# Altium project Smart-Watch-v1.0.PrjPcb
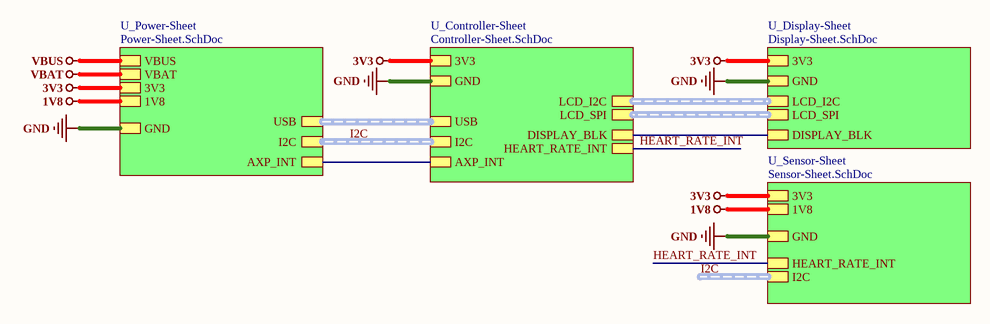
[diagram p0: Top-Sheet.SchDoc]
5 sheets, 64 parts. Net scope: hierarchical (ports join the sheet entries above them; power ports are global).
Board file: PCB_Smart-Watch-v1.0.PcbDoc
Sheets:
  Top-Sheet.SchDoc
    U_Power-Sheet = Power-Sheet.SchDoc
    U_Controller-Sheet = Controller-Sheet.SchDoc
    U_Display-Sheet = Display-Sheet.SchDoc
    U_Sensor-Sheet = Sensor-Sheet.SchDoc

## Sheet Top-Sheet.SchDoc
size A4; SheetNumber: 1; SheetTotal: 5

### Sub-sheets
U_Controller-Sheet = Controller-Sheet.SchDoc: LCD_I2C (harness LCD_I2C), USB (harness USB), LCD_SPI (harness LCD_SPI), DISPLAY_BLK, HEART_RATE_INT, GND, 3V3, AXP_INT, I2C (harness I2C)
U_Display-Sheet = Display-Sheet.SchDoc: LCD_SPI (harness LCD_SPI), DISPLAY_BLK, LCD_I2C (harness LCD_I2C), GND, 3V3
U_Power-Sheet = Power-Sheet.SchDoc: USB (harness USB), I2C (harness I2C), GND, 1V8, 3V3, VBAT, VBUS, AXP_INT
U_Sensor-Sheet = Sensor-Sheet.SchDoc: GND, 1V8, 3V3, HEART_RATE_INT, I2C (harness I2C)

### Nets
1V8: sheet U_Power-Sheet/1V8, sheet U_Sensor-Sheet/1V8
3V3: sheet U_Power-Sheet/3V3, sheet U_Controller-Sheet/3V3, sheet U_Display-Sheet/3V3, sheet U_Sensor-Sheet/3V3
GND: sheet U_Power-Sheet/GND, sheet U_Controller-Sheet/GND, sheet U_Display-Sheet/GND, sheet U_Sensor-Sheet/GND
AXP_INT: sheet U_Power-Sheet/AXP_INT, sheet U_Controller-Sheet/AXP_INT
DISPLAY_BLK: sheet U_Controller-Sheet/DISPLAY_BLK, sheet U_Display-Sheet/DISPLAY_BLK
HEART_RATE_INT: sheet U_Controller-Sheet/HEART_RATE_INT, sheet U_Sensor-Sheet/HEART_RATE_INT

### Buses and harness runs
harness I2C = sheet U_Controller-Sheet/I2C = sheet U_Power-Sheet/I2C
harness I2C = sheet U_Sensor-Sheet/I2C
harness sheet U_Controller-Sheet/LCD_I2C = sheet U_Display-Sheet/LCD_I2C
harness sheet U_Controller-Sheet/LCD_SPI = sheet U_Display-Sheet/LCD_SPI
harness sheet U_Controller-Sheet/USB = sheet U_Power-Sheet/USB

### Notes on the sheet
- File:
- Title:
- Date:
- Page
- Num:
- Total:
- Drawn By: Huzaifa Ali

## Sheet Power-Sheet.SchDoc
size A4; SheetNumber: 2; SheetTotal: 5
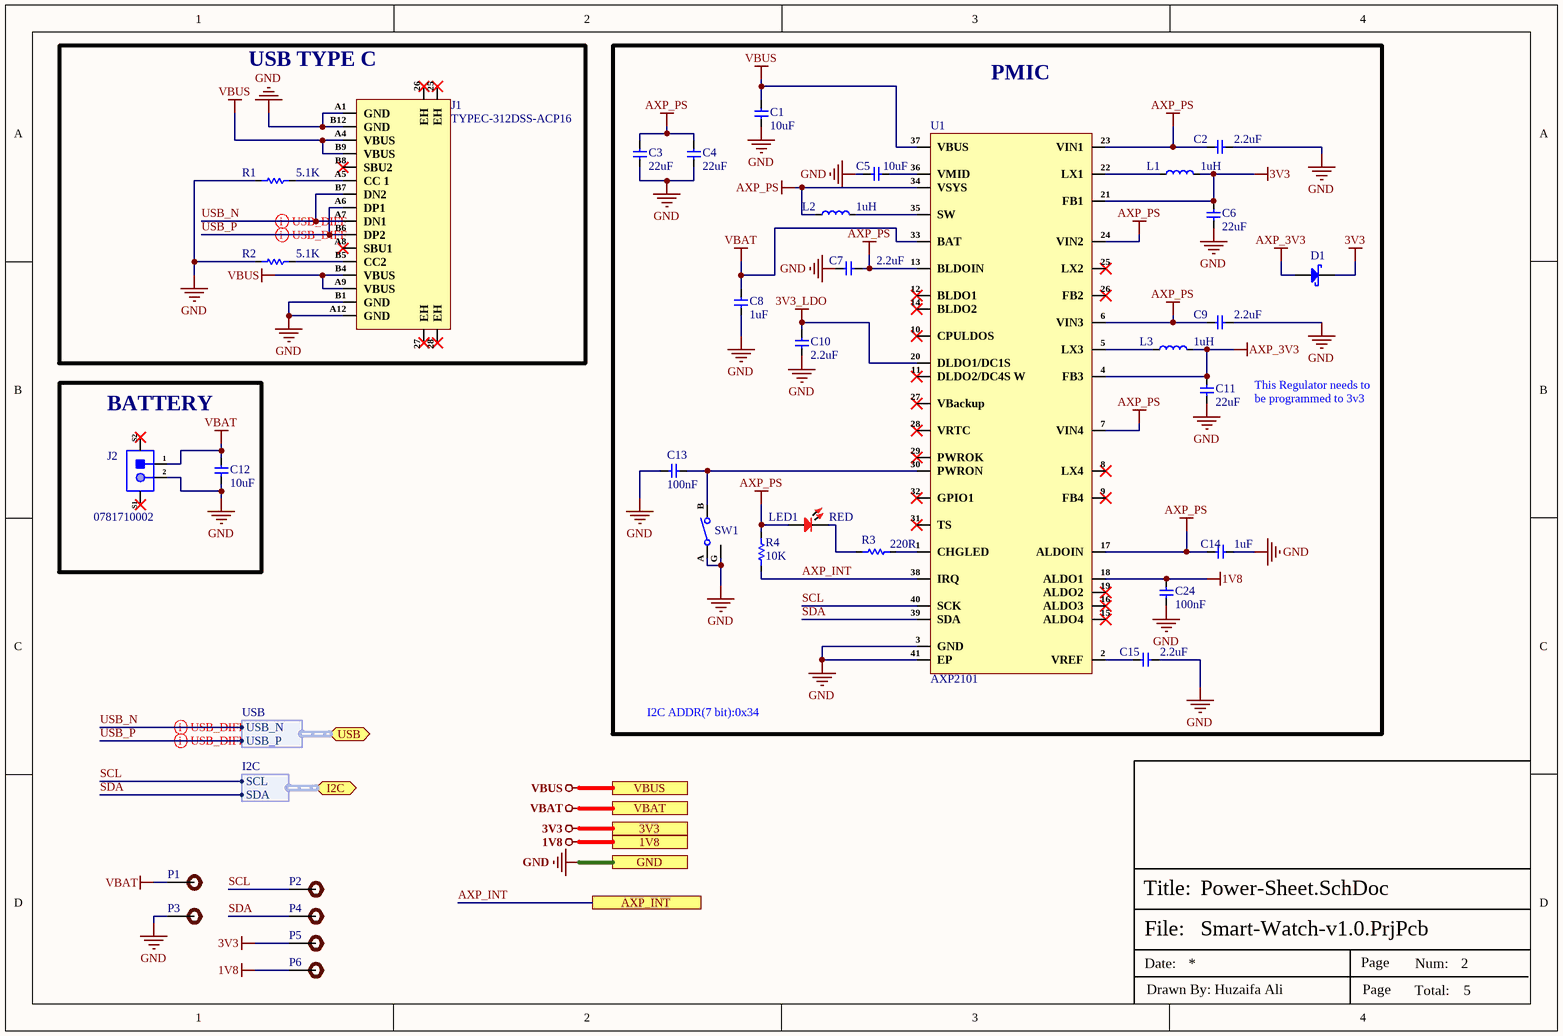
[diagram p1: Power-Sheet.SchDoc]

### Parts
C1  10uF  [Cap-0402]
C2  2.2uF  [CAP-0201]
C3  22uF  [Cap-0402]
C4  22uF  [Cap-0402]
C5  10uF  [Cap-0402]
C6  22uF  [Cap-0402]
C7  2.2uF  [CAP-0201]
C8  1uF  [CAP-0201]
C9  2.2uF  [CAP-0201]
C10  2.2uF  [CAP-0201]
C11  22uF  [Cap-0402]
C12  10uF  [Cap-0402]
C13  100nF  [CAP-0201]
C14  1uF  [CAP-0201]
C15  2.2uF  [CAP-0201]
C24  100nF  [CAP-0201]
D1  B5819WS  [SOD-323]  (value not drawn)
J1  TYPEC-312DSS-ACP16  [TYPEC-312DSS-ACP16]
J2  0781710002  [0781710002]
L1  1uH  [WPN201610M1R0MT]
L2  1uH  [WPN201610M1R0MT]
L3  1uH  [WPN201610M1R0MT]
LED1  RED  [LED-0201]
P1  TEST POINT 0.5mm Dia  [Test-point - 0.5mm]  (value not drawn)
P2  TEST POINT 0.5mm Dia  [Test-point - 0.5mm]  (value not drawn)
P3  TEST POINT 0.5mm Dia  [Test-point - 0.5mm]  (value not drawn)
P4  TEST POINT 0.5mm Dia  [Test-point - 0.5mm]  (value not drawn)
P5  TEST POINT 0.5mm Dia  [Test-point - 0.5mm]  (value not drawn)
P6  TEST POINT 0.5mm Dia  [Test-point - 0.5mm]  (value not drawn)
R1  5.1K  [Res-0201]
R2  5.1K  [Res-0201]
R3  220R  [Res-0201]
R4  10K  [Res-0201]
SW1  R-667799  [R-667799]  (value not drawn)
U1  AXP2101  [40-QFN (5mm×5mm)]

### Blocks framed on the sheet
USB TYPE C: J1 R1 R2
PMIC: C1-C11 C13-C15 C24 D1 L1-L3 LED1 R3 R4 SW1 U1
BATTERY: C12 J2

### Ports
1V8 (see Top-Sheet[1B], Sensor-Sheet[3C]), 3V3 (see Top-Sheet[1B], Controller-Sheet[3D], Display-Sheet[3D], Sensor-Sheet[3C]), AXP_INT (see Top-Sheet[2B], Controller-Sheet[3D]), GND (see Top-Sheet[1B], Controller-Sheet[3D], Display-Sheet[3D], Sensor-Sheet[3C]), I2C (bidir, harness I2C, see Top-Sheet[2B], Controller-Sheet[1D], Sensor-Sheet[3C]), USB (bidir, harness USB, see Top-Sheet[2B], Controller-Sheet[2D]), VBAT (see Top-Sheet[1B]), VBUS (see Top-Sheet[1B])

### Harnesses
USB: USB_N, USB_P
I2C: SCL, SDA

### Nets
1V8: C24.2 P6.1 U1.18(ALDO1) ; port 1V8
3V3: C6.2 D1.1(K) L1.2 P5.1 U1.21(FB1) ; port 3V3
3V3_LDO: C10.2 U1.20(DLDO1/DC1S)
AXP_3V3: C11.2 D1.2(A) L3.2 U1.4(FB3)
AXP_PS: C2.1 C3.2 C4.2 C7.2 C9.1 C14.2 L2.1 LED1.1 R4.2 U1.6(VIN3) U1.7(VIN4) U1.13(BLDOIN) U1.17(ALDOIN) U1.23(VIN1) U1.24(VIN2) U1.34(VSYS)
GND: C1.1 C2.2 C3.1 C4.1 C5.2 C6.1 C7.1 C8.1 C9.2 C10.1 C11.1 C12.2 C13.2 C14.1 C15.2 C24.1 J1.A1(GND) J1.A12(GND) J1.B1(GND) J1.B12(GND) J2.2 P3.1 R1.1 R2.1 SW1.A SW1.G U1.3(GND) U1.41(EP) ; port GND
VBAT: C8.2 C12.1 J2.1 P1.1 U1.33(BAT) ; port VBAT
VBUS: C1.2 J1.A4(VBUS) J1.A9(VBUS) J1.B4(VBUS) J1.B9(VBUS) U1.37(VBUS) ; port VBUS
AXP_INT: R4.1 U1.38(IRQ) ; port AXP_INT
SCL: P2.1 U1.40(SCK) ; port I2C.SCL  [project net I2C.SCL]
SDA: P4.1 U1.39(SDA) ; port I2C.SDA  [project net I2C.SDA]
USB_N: J1.A7(DN1) J1.B7(DN2) ; port USB.USB_N
USB_P: J1.A6(DP1) J1.B6(DP2) ; port USB.USB_P
NetC5_1: C5.1 U1.36(VMID)
NetC13_1: C13.1 SW1.B U1.30(PWRON)
NetC15_1: C15.1 U1.2(VREF)
NetJ1_A5: J1.A5(CC_1) R1.2
NetJ1_B5: J1.B5(CC2) R2.2
NetL1_1: L1.1 U1.22(LX1)
NetL2_2: L2.2 U1.35(SW)
NetL3_1: L3.1 U1.5(LX3)
NetLED1_2: LED1.2 R3.1
NetR3_2: R3.2 U1.1(CHGLED)

Not connected (* = marked no-connect by the designer): J1 25(EH)* 26(EH)* 27(EH)* 28(EH)* A8(SBU1)* B8(SBU2)*; J2 S1* S2*; U1 8(LX4)* 9(FB4)* 10(CPULDOS)* 11(DLDO2/DC4S_W)* 12(BLDO1)* 14(BLDO2)* 15(ALDO4)* 16(ALDO3)* 19(ALDO2)* 25(LX2)* 26(FB2)* 27(VBackup)* 28(VRTC)* 29(PWROK)* 31(TS)* 32(GPIO1)*

### Layout directives
differential pair; net class USB_DIFF; differential pair class USB_DIFF_Lines; rule Matched Net Lengths [Tolerance = 20mil]; rule Impedance Constraint [Min = 85.00    Max = 95.00    ]: USB_N, USB_P

### Notes on the sheet
- This Regulator needs to be programmed to 3v3
- I2C ADDR(7 bit):0x34
- File:
- Title:
- Date:
- Page
- Num:
- Total:
- Drawn By: Huzaifa Ali

### Library data of the parts
C1 C5 C12 = CC0402MRX5R6BB106: CAP CER 10UF 10V X5R 0402; Manufacturer: Yageo; Tolerance: 20%; Item Type: Capacitor; Supplier 1: Future Electronics; Manufacturer Part Number: CC0402MRX5R6BB106; RoHS: Yes; Category: Ceramic Capacitors; Stock 1: 80000; Pricing 1: 10000=0.02650, 20000=0.02590, 30000=0.02550, 40000=0.02530, 50000=0.02450 (USD); Mount: Surface Mount; Case/Package: 0402; Case Code (Imperial): 0402; Case Code (Metric): 1005; Min Operating Temperature: -55°C; Max Operating Temperature: 85°C; Packaging: Tape and Reel; Capacitance: 10uF; Voltage Rating: 10V; RoHS Compliant: Yes; ComponentLink1URL: http://www.yageo.com/documents/recent/UPY-GPHC_X5R_4V-to-50V_25.pdf?src-supplier=Digi-Key; ComponentLink1Description: http://www.yageo.com/documents/recent/UPY-GPHC_X5R_4V-to-50V_25.pdf?src-supplier=Digi-Key; Supplier Part Number 1: 6097631; LCSC Part Number: C962143
C2 C7 C9 C10 C15 = CC0201MRX5R6BB225: CAP CER 2.2UF 10V X5R 0201; Manufacturer: Yageo; Tolerance: 20%; Item Type: Capacitor; Supplier: Mouser; Supplier Part Number: 603-CC0201MRX56BB225; Manufacturer Part Number: CC0201MRX5R6BB225; RoHS: Yes; Category: Ceramic Capacitors; Stock: 25553; Pricing: 1=0.43, 10=0.294, 50=0.294, 100=0.176, 1000=0.112, 10000=0.091 (USD); Mounting Technology: Surface Mount; Case/Package: 0201; Min Operating Temperature: -55°C; Max Operating Temperature: 85°C; Packaging: Tape and Reel; Value: 2.2uF; Voltage Rating: 10V; Series: CC; RoHS Compliant: Yes; ComponentLink1URL: https://www.yageo.com/upload/media/product/productsearch/datasheet/mlcc/UPY-GPHC_X5R_4V-to-50V_26.pdf?src-supplier=Digi-Key; ComponentLink1Description: https://www.yageo.com/upload/media/product/productsearch/datasheet/mlcc/UPY-GPHC_X5R_4V-to-50V_26.pdf?src-supplier=Digi-Key; LCSC Part Number: C2186869
C3 C4 C6 C11 = GRM158R61A226ME15D: CAP CER 22UF 10V X5R 0402; Item Type: Capacitor; Material: 4241ConductorMaterial; Dielectric: 1537DielectricType; Tolerance: 20%; Supplier: Digi-Key; Supplier Part Number: 490-GRM158R61A226ME15DCT-ND; RoHS: Yes; Category: Ceramic Capacitors; Stock: 26634; Pricing: 1=0.45, 10=0.299, 50=0.2202, 100=0.1794, 500=0.1416, 1000=0.11957, 2500=0.11328 (USD); Case/Package: 343Case; Min Operating Temperature: -55°C; Max Operating Temperature: 85°C; Value: 22uF; Voltage Rating: 10V; Voltage Rating (DC): 10V; Length: 1mm; Width: 500um; Height: 800um; Thickness: 800um
C8 C14 = CC0201MRX5R7BB105: CAP CER 1UF 16V X5R 0201; Manufacturer: Yageo; Item Type: Capacitor; Supplier: Digi-Key; Supplier Part Number: 13-CC0201MRX5R7BB105TR-ND; Manufacturer Part Number: CC0201MRX5R7BB105; RoHS: Yes; Category: Ceramic Capacitors; LCSC Part Number: C5182464
C13 C24 = CC0201KRX5R6BB104: CAP CER 0.1UF 10V X5R 0201; Manufacturer: Yageo; Tolerance: 10%; Supplier 1: Mouser; Manufacturer Part Number: CC0201KRX5R6BB104; RoHS: Yes; Category: Ceramic Capacitors; Stock 1: 824403; Pricing 1: 1=0.10000, 10=0.02400, 50=0.02400, 100=0.01900, 1000=0.01100, 10000=0.00900 (USD); Mount: Surface Mount; Case/Package: 0201; Case Code (Imperial): 0201; Case Code (Metric): 0603; Weight: 6E-06oz; Min Operating Temperature: -55°C; Max Operating Temperature: 85°C; Capacitance: 100nF; Dielectric: X5R; Voltage Rating (DC): 10V; Packaging: Tape and Reel; Termination: SMD/SMT; Resistor Type: Ceramic; Voltage Rating: 10V; Series: CC; Construction: Flat; Length: 0.6mm; Width: 0.012inch; Height: 0.3mm; Thickness: 0.013inch; Depth: 0.3mm; Radiation Hardening: No; Lead Free: Lead Free; Halogen Free: Halogen Free; RoHS Compliant: Yes; ComponentLink1URL: https://datasheet.ciiva.com/11587/upy-gphc-x5r-4v-to-50v-12-11587190.pdf?src-supplier=Avnet; ComponentLink1Description: https://datasheet.ciiva.com/11587/upy-gphc-x5r-4v-to-50v-12-11587190.pdf?src-supplier=Avnet; Supplier Part Number 1: 603-CC201KRX5R6BB104; LCSC Part Number: C190183
D1 = B5819WS: DIODE SCHOTTKY 40V 1A SOD323; Manufacturer: MDD; Manufacturer Part Number: B5819WS-TP; Max Surge Current: 10A; Forward Voltage: 900mV; Max Reverse Leakage Current: 1mA; Element Configuration: Single; Supplier 1: Arrow Electronics; RoHS: Yes; Category: Rectifier Diodes; Stock 1: 1701; Pricing 1: 1=0.34370, 10=0.18990, 25=0.18810, 100=0.11820, 250=0.11700, 500=0.08890, 1000=0.07420 (USD); Mount: Surface Mount; Number of Pins: 2; Min Operating Temperature: -65°C; Max Operating Temperature: 125°C; Package Quantity: 1; Packaging: Tape and Reel; Average Rectified Current: 1A; Peak Non-Repetitive Surge Current: 10A; Max Reverse Voltage (DC): 40V; Series: -; Radiation Hardening: No; RoHS Compliant: Yes; Lead Free: Lead Free; Supplier Part Number 1: B5819WS-TP; ComponentLink1Description: LCSC; ComponentLink1URL: https://lcsc.com/product-detail/Schottky-Barrier-Diodes-SBD_MDD-Microdiode-Electronics-B5819WS_C64886.html; LCSC Part Number: C22624; Item Type: Diode
J1 = TYPEC-312DSS-ACP16: USB 3.1 5A 1 260℃ Surface Mount 16P Female -45℃~+85℃ Type-C SMD USB Connectors ROHS; Manufacturer: XUNPU; Manufacturer Part Number: TYPEC-312DSS-ACP16; Package: Custom; LCSC Part Number: C2909601; Item Type: Type-C SMD USB; ComponentLink1Description: LCSC; ComponentLink1URL: https://www.lcsc.com/product-detail/USB-Connectors_XUNPU-TYPEC-312DSS-ACP16_C2909601.html
J2 = 0781710002: CONN HEADER SMD 2POS 1.2MM; Manufacturer: Molex; Item Type: To Board / Wire To Wire Connector; Contact Resistance: 20mR; Max Voltage Rating (AC): 50V; Number of Contacts: 2; Manufacturer Part Number: 0781710002; Package: Custom; LCSC Part Number: C505023; ComponentLink1Description: LCSC; ComponentLink1URL: https://www.lcsc.com/product-detail/Wire-To-Board-Wire-To-Wire-Connector_MOLEX-781710002_C505023.html; Supplier: Mouser; Supplier Part Number: 538-78171-0002; RoHS: Yes; Stock: 82070; Pricing: 1=0.39, 10=0.313, 50=0.313, 100=0.228, 1000=0.181, 10000=0.141 (USD); Housing Material: Polymer; Contact Plating: Gold; Contact Material: Copper Alloy; Housing Color: Black; Min Operating Temperature: -25°C; Max Operating Temperature: 85°C; Number of Rows: 1; Packaging: Tape and Reel; Orientation: Straight; Termination: Solder; Length: 4.2mm; Pitch: 1.2mm; Depth: 4.5mm; Radiation Hardening: No; RoHS Compliant: Yes
L1-L3 = WPN201610M1R0MT: 2.05A 1uH ±20% 3.35A 0806 Power Inductors ROHS; Manufacturer: Sunlord; Supplier: Digi-Key; Supplier Part Number: 3442-WPN201610M1R0MTTR-ND; Manufacturer Part Number: WPN201610M1R0MT; RoHS: Yes; Pricing: 2000=0.17776 (USD); RoHS Compliant: Yes; LCSC Part Number: C97010; Item Type: Inductor
LED1 = XL-0201SURC: 40mcd~75mcd 透明透镜 620nm~630nm -30℃~+85℃ Positive post Red 120° 55mW 0201 Light Emitting Diodes (LED) ROHS; Manufacturer: XINGLIGHT; Manufacturer Part Number: XL-0201SURC; Package: 0201; LCSC Part Number: C3646923; Item Type: LED; ComponentLink1Description: LCSC; ComponentLink1URL: https://www.lcsc.com/product-detail/Light-Emitting-Diodes-LED_XINGLIGHT-XL-0201SURC_C3646923.html
P1-P6 = TEST POINT 0.5mm Dia: Test Point ON; Item Type: Test Point
R1 R2 = RC0201FR-075K1L: RES 5.1K OHM 1% 1/20W 0201; Manufacturer: Yageo; Power Rating: 50mW; Value: 5.1kR; Voltage Rating: 25V; Temperature Coefficient: 200ppm/°C; Item Type: Resistor; Supplier: Future Electronics; Supplier Part Number: 9072847; Manufacturer Part Number: RC0201FR-075K1L; RoHS: Yes; Category: Chip SMD Resistors; Stock: 280000; Pricing: 10000=0.0014, 40000=0.0013, 200000=0.0013, 400000=0.0012, 1250000=0.0011 (USD); Case/Package: 0201; Case Code (Imperial): 0201; Case Code (Metric): 0603; Min Operating Temperature: -55°C; Max Operating Temperature: 125°C; Packaging: Tape and Reel; Tolerance: 1%; Termination: SMD/SMT; Number of Terminations: 2; Max Power Dissipation: 50mW; Features: Moisture Resistant; Series: RC; Length: 0.6mm; Width: 0.3mm; Height: 0.23mm; Lead Free: Lead Free; RoHS Compliant: Yes; ComponentLink1URL: http://www.mouser.com/ds/2/447/RC0201-559633.pdf?src-supplier=Mouser; ComponentLink1Description: http://www.mouser.com/ds/2/447/RC0201-559633.pdf?src-supplier=Mouser; ComponentLink2URL: https://datasheet.octopart.com/RC0201FR-075K1L-Yageo-datasheet-164759695.pdf?src-supplier=Future+Electronics; ComponentLink2Description: https://datasheet.octopart.com/RC0201FR-075K1L-Yageo-datasheet-164759695.pdf?src-supplier=Future+Electronics; ComponentLink3URL: http://www.yageo.com/documents/recent/PYu-RC_Group_51_RoHS_L_10.pdf?src-supplier=Digi-Key; ComponentLink3Description: http://www.yageo.com/documents/recent/PYu-RC_Group_51_RoHS_L_10.pdf?src-supplier=Digi-Key; LCSC Part Number: C274341
R3 = RC0201FR-07220RL: RES 220 OHM 1% 1/20W 0201; Manufacturer: Yageo; Temperature Coefficient: 200ppm/°C; Power Rating: 50mW; Voltage Rating: 25V; Supplier 1: Digi-Key; Manufacturer Part Number: RC0201FR-07220RL; RoHS: Yes; Category: Chip SMD Resistors; Stock 1: 189347; Pricing 1: 1=0.10000, 10=0.03600, 100=0.01480, 1000=0.00665, 2500=0.00577, 5000=0.00477 (USD); Case/Package: 0201; Contact Plating: Tin,Matte; Case Code (Imperial): 0201; Case Code (Metric): 0603; Min Operating Temperature: -55°C; Max Operating Temperature: 125°C; Resistance: 220R; Tolerance: 1%; Resistor Type: Thick Film; Packaging: Tape and Reel; Features: Moisture Resistant; Max Power Dissipation: 50mW; Number of Terminations: 2; Termination: SMD/SMT; Length: 0.6mm; Width: 0.012inch; Height: 0.01inch; Depth: 0.3mm; Radiation Hardening: No; REACH SVHC: Unknown; Military Standard: Not; ComponentLink1URL: https://datasheet.ciiva.com/7672/1563626-7672213.pdf?src-supplier=Element14; ComponentLink1Description: https://datasheet.ciiva.com/7672/1563626-7672213.pdf?src-supplier=Element14; ComponentLink2URL: https://datasheet.ciiva.com/8886/pyu-rc0201-51-rohs-l-8-8886758.pdf?src-supplier=Avnet; ComponentLink2Description: https://datasheet.ciiva.com/8886/pyu-rc0201-51-rohs-l-8-8886758.pdf?src-supplier=Avnet; ComponentLink3URL: https://datasheet.ciiva.com/16855/pyu-rc0201-51-rohs-l-8-16855847.pdf?src-supplier=Avnet+Europe; ComponentLink3Description: https://datasheet.ciiva.com/16855/pyu-rc0201-51-rohs-l-8-16855847.pdf?src-supplier=Avnet+Europe; ComponentLink4URL: https://datasheet.ciiva.com/28393/pyu-rc0201-51-rohs-l-8-28393063.pdf?src-supplier=Avnet+Europe; ComponentLink4Description: https://datasheet.ciiva.com/28393/pyu-rc0201-51-rohs-l-8-28393063.pdf?src-supplier=Avnet+Europe; Supplier Part Number 1: YAG2509CT-ND; LCSC Part Number: C274342
R4 = RC0201FR-0710KL: RES SMD 10K OHM 1% 1/20W 0201; Manufacturer: Yageo; Item Type: Resistor; Manufacturer Part Number: RC0201FR-0710KL; Package: 0201; ComponentLink7Description: LCSC; ComponentLink7URL: https://www.lcsc.com/product-detail/Chip-Resistor-Surface-Mount_YAGEO-RC0201FR-0710KL_C106225.html; LCSC Part Number: C106225
SW1 = R-667799: SWITCH TACTILE, SPST-NO, 0.05A 1; Manufacturer: Mitsumi; Item Type: Tactile Switch; Supplier: Digi-Key; Supplier Part Number: 2508-R-667799CT-ND; Manufacturer Part Number: R-667799; RoHS: No; Category: Tactile Switches; Stock: 11526; Pricing: 1=0.32, 10=0.31, 25=0.2944, 100=0.2666, 250=0.24304, 500=0.2259, 1000=0.19271, 2500=0.18736 (USD)
U1 = AXP2101: QFN-40-EP(5x5) Microcontroller Units (MCUs/MPUs/SOCs) ROHS; Manufacturer: X-Powers Tech; Item Type: IC; Manufacturer Part Number: AXP2101; Package: QFN-40-EP(5x5); JLCPCB Part Number: C3036461

## Sheet Controller-Sheet.SchDoc
size A4; SheetNumber: 3; SheetTotal: 5
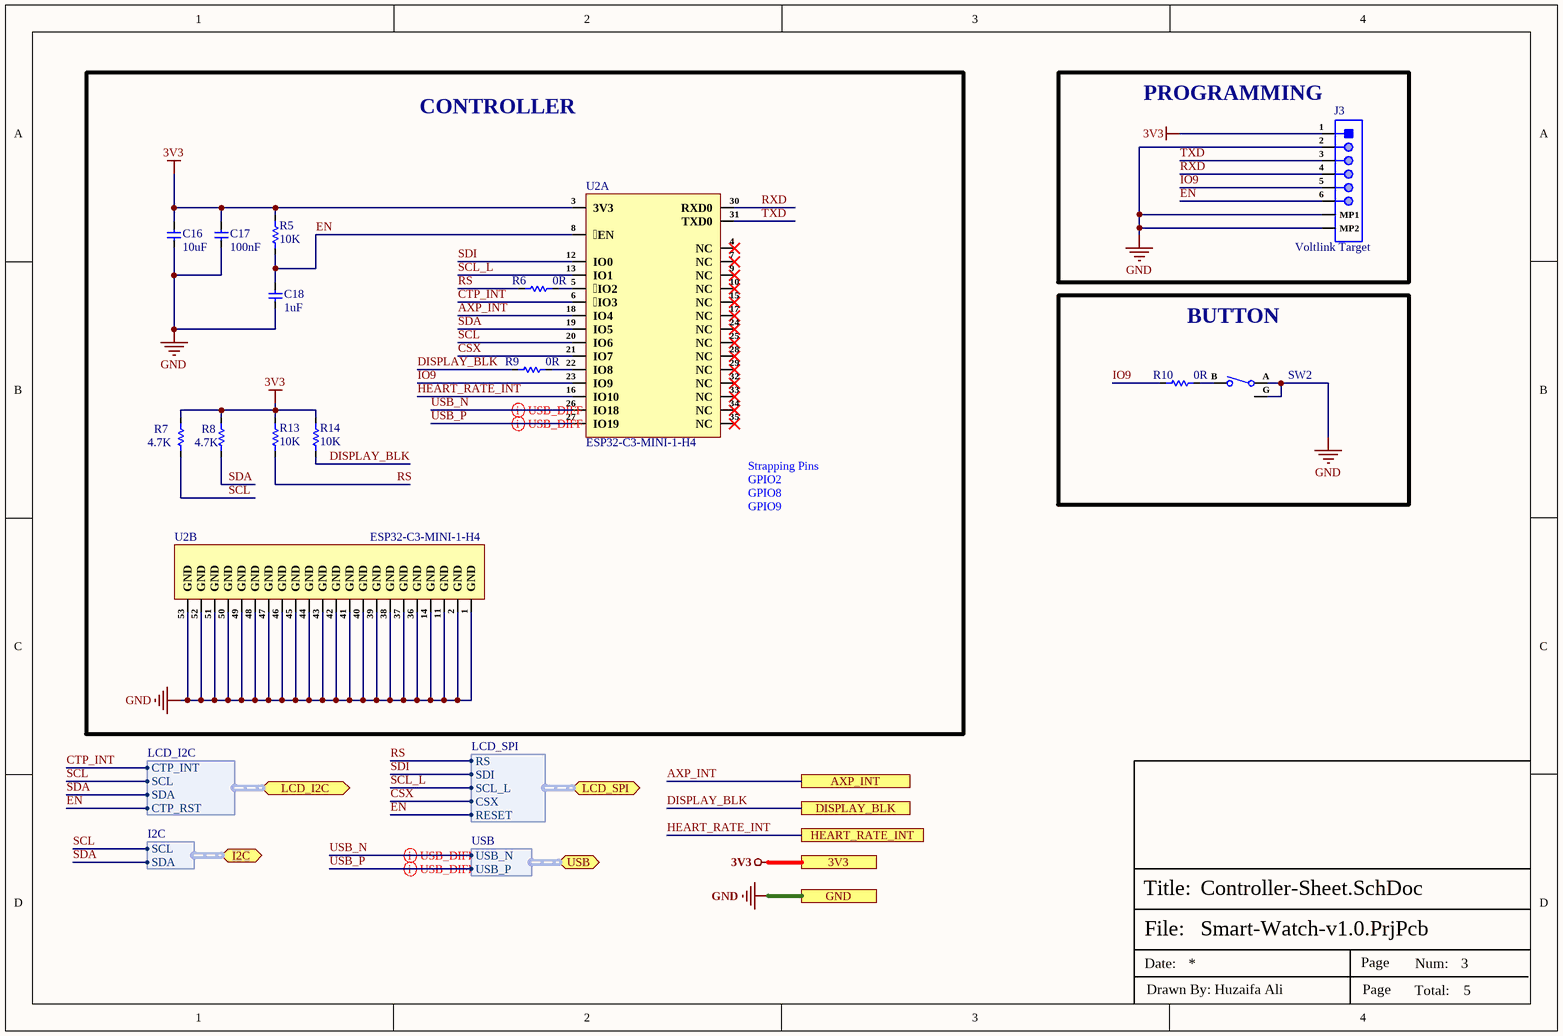
[diagram p2: Controller-Sheet.SchDoc]

### Parts
C16  10uF  [Cap-0402]
C17  100nF  [CAP-0201]
C18  1uF  [CAP-0201]
J3  Voltlink Target  [Voltlink Target]
R5  10K  [Res-0201]
R6  0R  [Res-0201]
R7  4.7K  [Res-0201]
R8  4.7K  [Res-0201]
R9  0R  [Res-0201]
R10  0R  [Res-0201]
R13  10K  [Res-0201]
R14  10K  [Res-0201]
SW2  R-667799  [R-667799]  (value not drawn)
U2  ESP32-C3-MINI-1-H4  [ESP32-C3-MINI-1-H4]  (parts A,B of 2)

### Blocks framed on the sheet
CONTROLLER: C16-C18 R5-R9 R13 R14 U2
PROGRAMMING: J3
BUTTON: R10 SW2

### Ports
3V3 (see Top-Sheet[2B], Display-Sheet[3D], Power-Sheet[2D], Sensor-Sheet[3C]), AXP_INT (see Top-Sheet[2B], Power-Sheet[2D]), DISPLAY_BLK (see Top-Sheet[2B], Display-Sheet[2D]), GND (see Top-Sheet[2B], Display-Sheet[3D], Power-Sheet[2D], Sensor-Sheet[3C]), HEART_RATE_INT (see Top-Sheet[2B], Sensor-Sheet[3C]), I2C (bidir, harness I2C, see Top-Sheet[2B], Power-Sheet[1D], Sensor-Sheet[3C]), LCD_I2C (bidir, harness LCD_I2C, see Top-Sheet[2B], Display-Sheet[2D]), LCD_SPI (bidir, harness LCD_SPI, see Top-Sheet[2B], Display-Sheet[2D]), USB (bidir, harness USB, see Top-Sheet[2B], Power-Sheet[1C])

### Harnesses
LCD_I2C: CTP_INT, SCL, SDA, CTP_RST
USB: USB_N, USB_P
LCD_SPI: RS, SDI, SCL_L, CSX, RESET
I2C: SCL, SDA

### Nets
3V3: C16.2 C17.2 J3.1 R5.2 R7.2 R8.2 R13.2 R14.2 U2.3(3V3) ; port 3V3
GND: C16.1 C17.1 C18.1 J3.2 J3.MP1 J3.MP2 SW2.A SW2.G U2.1(GND) U2.2(GND) U2.11(GND) U2.14(GND) U2.36(GND) U2.37(GND) U2.38(GND) U2.39(GND) U2.40(GND) U2.41(GND) U2.42(GND) U2.43(GND) U2.44(GND) U2.45(GND) U2.46(GND) U2.47(GND) U2.48(GND) U2.49(GND) U2.50(GND) U2.51(GND) U2.52(GND) U2.53(GND) ; port GND
AXP_INT: U2.18(IO4) ; port AXP_INT
CSX: U2.21(IO7) ; port LCD_SPI.CSX
CTP_INT: U2.6(IO3) ; port LCD_I2C.CTP_INT
DISPLAY_BLK: R9.1 R14.1 ; port DISPLAY_BLK
EN: C18.2 J3.6 R5.1 U2.8(EN) ; port LCD_I2C.CTP_RST, port LCD_SPI.RESET  [project net CTP_RST]
HEART_RATE_INT: U2.16(IO10) ; port HEART_RATE_INT
IO9: J3.5 R10.1 U2.23(IO9)
RS: R6.1 R13.1 ; port LCD_SPI.RS
RXD: J3.4 U2.30(RXD0)
SCL: R7.1 U2.20(IO6) ; port LCD_I2C.SCL, port I2C.SCL  [project net I2C.SCL]
SCL_L: U2.13(IO1) ; port LCD_SPI.SCL_L
SDA: R8.1 U2.19(IO5) ; port LCD_I2C.SDA, port I2C.SDA  [project net I2C.SDA]
SDI: U2.12(IO0) ; port LCD_SPI.SDI
TXD: J3.3 U2.31(TXD0)
USB_N: U2.26(IO18) ; port USB.USB_N
USB_P: U2.27(IO19) ; port USB.USB_P
NetR6_2: R6.2 U2.5(IO2)
NetR9_2: R9.2 U2.22(IO8)
NetR10_2: R10.2 SW2.B

Not connected (* = marked no-connect by the designer): U2 4(NC)* 7(NC)* 9(NC)* 10(NC)* 15(NC)* 17(NC)* 24(NC)* 25(NC)* 28(NC)* 29(NC)* 32(NC)* 33(NC)* 34(NC)* 35(NC)*

### Layout directives
differential pair; net class USB_DIFF; differential pair class USB_DIFF_Lines; rule Matched Net Lengths [Tolerance = 20mil]; rule Impedance Constraint [Min = 85.00    Max = 95.00    ]: USB_N, USB_P

### Notes on the sheet
- (near U2) Strapping Pins
  GPIO2
  GPIO8
  GPIO9
- File:
- Title:
- Date:
- Page
- Num:
- Total:
- Drawn By: Huzaifa Ali

### Library data of the parts
C16 = CC0402MRX5R6BB106: as C1 on sheet Power-Sheet; Supplier 1: Future Electronics; Manufacturer Part Number: CC0402MRX5R6BB106; RoHS: Yes; Category: Ceramic Capacitors; Stock 1: 80000; Pricing 1: 10000=0.02650, 20000=0.02590, 30000=0.02550, 40000=0.02530, 50000=0.02450 (USD); Mount: Surface Mount; Case/Package: 0402; Case Code (Imperial): 0402; Case Code (Metric): 1005; Min Operating Temperature: -55°C; Max Operating Temperature: 85°C; Packaging: Tape and Reel; Capacitance: 10uF; Voltage Rating: 10V; RoHS Compliant: Yes; ComponentLink1URL: http://www.yageo.com/documents/recent/UPY-GPHC_X5R_4V-to-50V_25.pdf?src-supplier=Digi-Key; ComponentLink1Description: http://www.yageo.com/documents/recent/UPY-GPHC_X5R_4V-to-50V_25.pdf?src-supplier=Digi-Key; Supplier Part Number 1: 6097631; LCSC Part Number: C962143
C17 = CC0201KRX5R6BB104: as C13 on sheet Power-Sheet; Supplier 1: Mouser; Manufacturer Part Number: CC0201KRX5R6BB104; RoHS: Yes; Category: Ceramic Capacitors; Stock 1: 824403; Pricing 1: 1=0.10000, 10=0.02400, 50=0.02400, 100=0.01900, 1000=0.01100, 10000=0.00900 (USD); Mount: Surface Mount; Case/Package: 0201; Case Code (Imperial): 0201; Case Code (Metric): 0603; Weight: 6E-06oz; Min Operating Temperature: -55°C; Max Operating Temperature: 85°C; Capacitance: 100nF; Dielectric: X5R; Voltage Rating (DC): 10V; Packaging: Tape and Reel; Termination: SMD/SMT; Resistor Type: Ceramic; Voltage Rating: 10V; Series: CC; Construction: Flat; Length: 0.6mm; Width: 0.012inch; Height: 0.3mm; Thickness: 0.013inch; Depth: 0.3mm; Radiation Hardening: No; Lead Free: Lead Free; Halogen Free: Halogen Free; RoHS Compliant: Yes; ComponentLink1URL: https://datasheet.ciiva.com/11587/upy-gphc-x5r-4v-to-50v-12-11587190.pdf?src-supplier=Avnet; ComponentLink1Description: https://datasheet.ciiva.com/11587/upy-gphc-x5r-4v-to-50v-12-11587190.pdf?src-supplier=Avnet; Supplier Part Number 1: 603-CC201KRX5R6BB104; LCSC Part Number: C190183
C18 = CC0201MRX5R7BB105: as C8 on sheet Power-Sheet; Supplier: Digi-Key; Supplier Part Number: 13-CC0201MRX5R7BB105TR-ND; Manufacturer Part Number: CC0201MRX5R7BB105; RoHS: Yes; Category: Ceramic Capacitors; LCSC Part Number: C5182464
J3 = C145963: 1x6P SH 1 1mm 6 SMD,P=1mm Wire To Board / Wire To Wire Connector ROHS; Manufacturer: BOOMELE; Manufacturer Part Number: C145963; Package: SMD,P=1mm; LCSC Part Number: C145963; Item Type: Connector; ComponentLink1Description: LCSC; ComponentLink1URL: https://www.lcsc.com/product-detail/Wire-To-Board-Wire-To-Wire-Connector_BOOMELE-Boom-Precision-Elec-C145963_C145963.html
R5 R13 R14 = RC0201FR-0710KL: as R4 on sheet Power-Sheet; Manufacturer Part Number: RC0201FR-0710KL; Package: 0201; ComponentLink7Description: LCSC; ComponentLink7URL: https://www.lcsc.com/product-detail/Chip-Resistor-Surface-Mount_YAGEO-RC0201FR-0710KL_C106225.html; LCSC Part Number: C106225
R6 R9 R10 = RC0201JR-070RL: RES SMD 0 OHM JUMPER 1/20W 0201; Manufacturer: Yageo; Power Rating: 50mW; Tolerance: 5%; Voltage Rating: 25V; Supplier 1: Digi-Key; Manufacturer Part Number: RC0201JR-070RL; RoHS: Yes; Category: Chip SMD Resistors; Stock 1: 11079; Pricing 1: 1=0.10000, 10=0.03600, 25=0.02640, 50=0.02000, 100=0.01480, 250=0.01128, 500=0.00904, 1000=0.00665, 5000=0.00477 (USD); Case/Package: 0201; Contact Plating: Tin,Matte; Case Code (Metric): 0603; Case Code (Imperial): 0201; Weight: 6E-06oz; Size Code: 0201; Min Operating Temperature: -55°C; Max Operating Temperature: 125°C; Resistor Type: Thick Film; Resistance: 0R; Packaging: Tape and Reel; Package Quantity: 10000; Number of Terminations: 2; Termination: SMD/SMT; Max Power Dissipation: 50mW; Voltage Rating (DC): 25V; Features: Moisture Resistant; Series: RC; Construction: Rectangular; Resistance Tolerance: 5%; Length: 0.6mm; Width: 0.012inch; Height: 0.01inch; Depth: 0.3mm; Radiation Hardening: No; RoHS Compliant: Yes; REACH SVHC: Unknown; Military Standard: Not; Lead Free: Lead Free; ComponentLink1URL: https://datasheet.ciiva.com/7672/1563626-7672247.pdf?src-supplier=Element14; ComponentLink1Description: https://datasheet.ciiva.com/7672/1563626-7672247.pdf?src-supplier=Element14; ComponentLink2URL: https://datasheet.ciiva.com/7660/1421516-7660808.pdf?src-supplier=Element14; ComponentLink2Description: https://datasheet.ciiva.com/7660/1421516-7660808.pdf?src-supplier=Element14; ComponentLink3URL: https://datasheet.ciiva.com/7672/1563626-7672248.pdf?src-supplier=Element14; ComponentLink3Description: https://datasheet.ciiva.com/7672/1563626-7672248.pdf?src-supplier=Element14; ComponentLink4URL: https://datasheet.ciiva.com/16855/pyu-rc0201-51-rohs-l-8-16855994.pdf?src-supplier=Avnet+Europe; ComponentLink4Description: https://datasheet.ciiva.com/16855/pyu-rc0201-51-rohs-l-8-16855994.pdf?src-supplier=Avnet+Europe; ComponentLink5URL: https://datasheet.ciiva.com/28419/pyu-rc0201-51-rohs-l-8-28419660.pdf?src-supplier=Avnet+Europe; ComponentLink5Description: https://datasheet.ciiva.com/28419/pyu-rc0201-51-rohs-l-8-28419660.pdf?src-supplier=Avnet+Europe; ComponentLink6URL: https://datasheet.ciiva.com/46391/1421516-46391340.pdf?src-supplier=Element14; ComponentLink6Description: https://datasheet.ciiva.com/46391/1421516-46391340.pdf?src-supplier=Element14; ComponentLink7URL: https://datasheet.ciiva.com/8896/pyu-rc0201-51-rohs-l-8-8896143.pdf?src-supplier=Avnet; ComponentLink7Description: https://datasheet.ciiva.com/8896/pyu-rc0201-51-rohs-l-8-8896143.pdf?src-supplier=Avnet; Supplier Part Number 1: 311-0.0NCT-ND; LCSC Part Number: C106228
R7 R8 = RC0201FR-074K7L: RES 4.7K OHM 1% 1/20W 0201; Manufacturer: Yageo; Item Type: Resistor; Supplier: Future Electronics; Supplier Part Number: 7537285; Manufacturer Part Number: RC0201FR-074K7L; RoHS: Yes; Category: Chip SMD Resistors; Stock: 1610000; Pricing: 10000=0.0014, 50000=0.0013, 250000=0.0013, 750000=0.0012, 2000000=0.0011 (USD); ComponentLink1URL: https://datasheet.ciiva.com/2493/pyu-r-int-thick-7-2493811.pdf?src-supplier=Digi-Key; ComponentLink1Description: https://datasheet.ciiva.com/2493/pyu-r-int-thick-7-2493811.pdf?src-supplier=Digi-Key; ComponentLink2URL: https://datasheet.ciiva.com/2493/pyu-r-int-thick-7-2493812.pdf?src-supplier=Digi-Key; ComponentLink2Description: https://datasheet.ciiva.com/2493/pyu-r-int-thick-7-2493812.pdf?src-supplier=Digi-Key; ComponentLink3URL: https://datasheet.ciiva.com/2493/pyu-r-int-thick-7-2493813.pdf?src-supplier=Digi-Key; ComponentLink3Description: https://datasheet.ciiva.com/2493/pyu-r-int-thick-7-2493813.pdf?src-supplier=Digi-Key; ComponentLink4URL: https://datasheet.ciiva.com/8892/pyu-rc0201-51-rohs-l-8-8892942.pdf?src-supplier=Avnet; ComponentLink4Description: https://datasheet.ciiva.com/8892/pyu-rc0201-51-rohs-l-8-8892942.pdf?src-supplier=Avnet; ComponentLink5URL: https://datasheet.ciiva.com/7672/1563626-7672233.pdf?src-supplier=Element14; ComponentLink5Description: https://datasheet.ciiva.com/7672/1563626-7672233.pdf?src-supplier=Element14; LCSC Part Number: C138135
SW2 = R-667799: as SW1 on sheet Power-Sheet; Supplier: Digi-Key; Supplier Part Number: 2508-R-667799CT-ND; Manufacturer Part Number: R-667799; RoHS: No; Category: Tactile Switches; Stock: 11526; Pricing: 1=0.32, 10=0.31, 25=0.2944, 100=0.2666, 250=0.24304, 500=0.2259, 1000=0.19271, 2500=0.18736 (USD)
U2 = ESP32-C3-MINI-1-H4: RF TXRX MODULE BT PCB TRACE SMD; Manufacturer: Espressif Systems; Manufacturer Part Number: ESP32-C3-MINI-1-H4; Package: SMD,13.2x16.6mm; LCSC Part Number: C2934569; Item Type: Module; ComponentLink1Description: LCSC; ComponentLink1URL: https://www.lcsc.com/product-detail/WiFi-Modules_Espressif-Systems-ESP32-C3-MINI-1-H4_C2934569.html; Supplier: Digi-Key; Supplier Part Number: 1965-ESP32-C3-MINI-1-H4CT-ND; RoHS: No; Category: Uncategorized; Stock: 35793; Pricing: 1=1.9 (USD)

## Sheet Display-Sheet.SchDoc
size A4; SheetNumber: 5; SheetTotal: 5
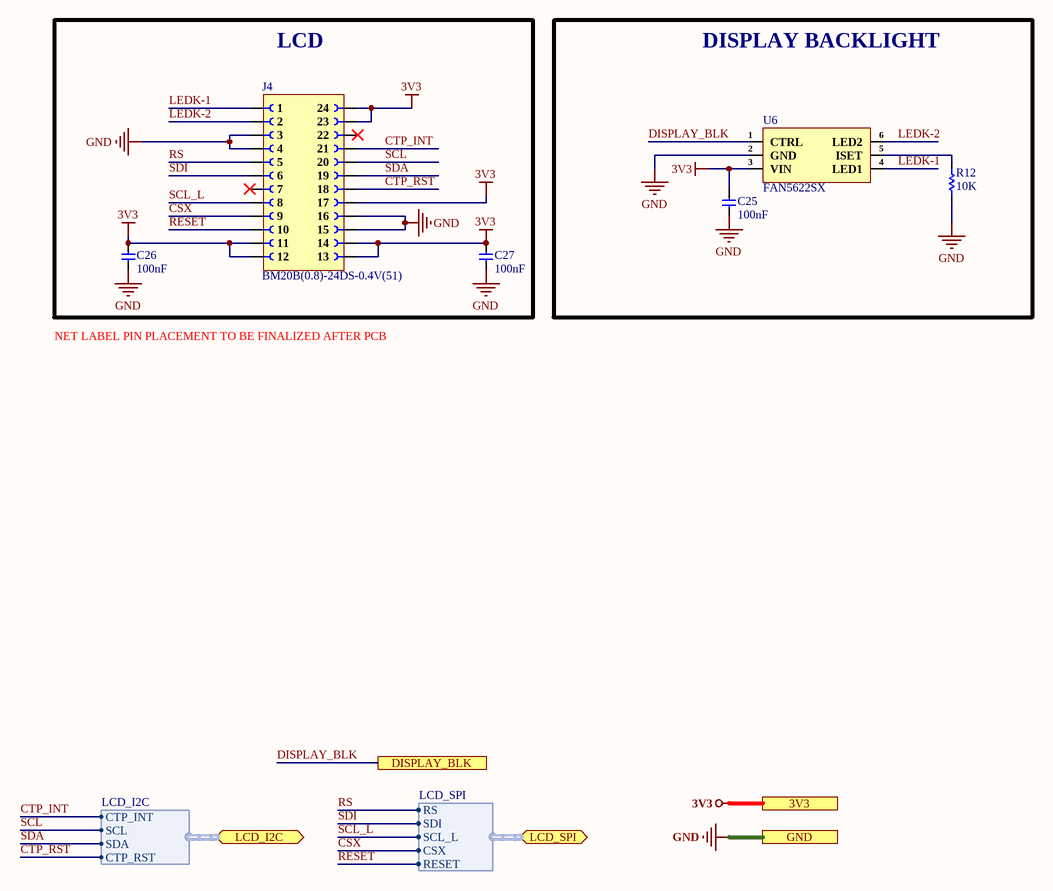
[diagram p3: Display-Sheet.SchDoc]

### Parts
C25  100nF  [CAP-0201]
C26  100nF  [CAP-0201]
C27  100nF  [CAP-0201]
J4  BM20B(0.8)-24DS-0.4V(51)  [BM20B(0.8)-24DS-0.4V(51)]
R12  10K  [Res-0201]
U6  FAN5622SX  [SuperSOT-6]

### Blocks framed on the sheet
LCD: C26 C27 J4
DISPLAY BACKLIGHT: C25 R12 U6

### Ports
3V3 (see Top-Sheet[3B], Controller-Sheet[3D], Power-Sheet[2D], Sensor-Sheet[3C]), DISPLAY_BLK (see Top-Sheet[3B], Controller-Sheet[3D]), GND (see Top-Sheet[3B], Controller-Sheet[3D], Power-Sheet[2D], Sensor-Sheet[3C]), LCD_I2C (bidir, harness LCD_I2C, see Top-Sheet[3B], Controller-Sheet[1D]), LCD_SPI (bidir, harness LCD_SPI, see Top-Sheet[3B], Controller-Sheet[2D])

### Harnesses
LCD_SPI: RS, SDI, SCL_L, CSX, RESET
LCD_I2C: CTP_INT, SCL, SDA, CTP_RST

### Nets
3V3: C25.2 C26.2 C27.2 J4.11 J4.12 J4.13 J4.14 J4.17 J4.23 J4.24 U6.3(VIN) ; port 3V3
GND: C25.1 C26.1 C27.1 J4.3 J4.4 J4.15 J4.16 R12.1 U6.2(GND) ; port GND
CSX: J4.9 ; port LCD_SPI.CSX
CTP_INT: J4.21 ; port LCD_I2C.CTP_INT
CTP_RST: J4.10 J4.18 ; port LCD_SPI.RESET, port LCD_I2C.CTP_RST  [also labelled RESET]
DISPLAY_BLK: U6.1(CTRL) ; port DISPLAY_BLK
LEDK-1: J4.1 U6.4(LED1)
LEDK-2: J4.2 U6.6(LED2)
RS: J4.5 ; port LCD_SPI.RS
SCL: J4.20 ; port LCD_I2C.SCL  [project net I2C.SCL]
SCL_L: J4.8 ; port LCD_SPI.SCL_L
SDA: J4.19 ; port LCD_I2C.SDA  [project net I2C.SDA]
SDI: J4.6 ; port LCD_SPI.SDI
NetR12_2: R12.2 U6.5(ISET)

Not connected (* = marked no-connect by the designer): J4 7* 22*

### Notes on the sheet
- NET LABEL PIN PLACEMENT TO BE FINALIZED AFTER PCB
- File:
- Title:
- Date:
- Page
- Num:
- Total:
- Drawn By: Huzaifa Ali

### Library data of the parts
C25-C27 = CC0201KRX5R6BB104: as C13 on sheet Power-Sheet; Supplier 1: Mouser; Manufacturer Part Number: CC0201KRX5R6BB104; RoHS: Yes; Category: Ceramic Capacitors; Stock 1: 824403; Pricing 1: 1=0.10000, 10=0.02400, 50=0.02400, 100=0.01900, 1000=0.01100, 10000=0.00900 (USD); Mount: Surface Mount; Case/Package: 0201; Case Code (Imperial): 0201; Case Code (Metric): 0603; Weight: 6E-06oz; Min Operating Temperature: -55°C; Max Operating Temperature: 85°C; Capacitance: 100nF; Dielectric: X5R; Voltage Rating (DC): 10V; Packaging: Tape and Reel; Termination: SMD/SMT; Resistor Type: Ceramic; Voltage Rating: 10V; Series: CC; Construction: Flat; Length: 0.6mm; Width: 0.012inch; Height: 0.3mm; Thickness: 0.013inch; Depth: 0.3mm; Radiation Hardening: No; Lead Free: Lead Free; Halogen Free: Halogen Free; RoHS Compliant: Yes; ComponentLink1URL: https://datasheet.ciiva.com/11587/upy-gphc-x5r-4v-to-50v-12-11587190.pdf?src-supplier=Avnet; ComponentLink1Description: https://datasheet.ciiva.com/11587/upy-gphc-x5r-4v-to-50v-12-11587190.pdf?src-supplier=Avnet; Supplier Part Number 1: 603-CC201KRX5R6BB104; LCSC Part Number: C190183
J4 = BM20B(0.8)-24DS-0.4V(51): CONN RCPT 24POS SMD GOLD; Manufacturer: Hirose Electric Co Ltd; Item Type: Connectors (Board to Board); Manufacturer Part Number: BM20B(0.8)-24DS-0.4V(51); Package: Custom; LCSC Part Number: C424537; ComponentLink1Description: LCSC; Supplier: Digi-Key; Supplier Part Number: 26-BM20B(0.8)-24DS-0.4V(51)CT-ND; RoHS: Yes; Category: Connectors; Stock: 5402; Pricing: 1=1.32, 10=1.114, 25=1.068, 50=1.0454, 100=0.9999, 250=0.909, 500=0.8181, 1000=0.7272, 2500=0.65902 (USD); ComponentLink2URL: https://datasheet.ciiva.com/24244/en-bm20-20130409-270407-24244272.pdf?src-supplier=Mouser; ComponentLink2Description: https://datasheet.ciiva.com/24244/en-bm20-20130409-270407-24244272.pdf?src-supplier=Mouser
R12 = RC0201FR-0710KL: as R4 on sheet Power-Sheet; Manufacturer Part Number: RC0201FR-0710KL; Package: 0201; ComponentLink7Description: LCSC; ComponentLink7URL: https://www.lcsc.com/product-detail/Chip-Resistor-Surface-Mount_YAGEO-RC0201FR-0710KL_C106225.html; LCSC Part Number: C106225
U6 = FAN5622SX: IC LED DRV LIN SGL WR 30MA 6SSOT; Manufacturer: ON Semiconductor / Fairchild; Max Supply Voltage: 5.5V; Min Supply Voltage: 2.7V; Number of Outputs: 2; Max Supply Current: 800uA; Power Dissipation: 132mW; Number of Segments: 6; Max Output Voltage: 5V; Supplier: Rs; Supplier Part Number: 7396049P; Manufacturer Part Number: FAN5622SX; RoHS: Yes; Category: LED Drivers; Stock: 2995; Pricing: 10=0.48, 100=0.288, 1000=0.218, 3000=0.212 (GBP); Mounting Technology: Surface Mount; Case/Package: SOT-23-6; Pins: 23; Weight: 0.03g; Min Operating Temperature: -40°C; Max Operating Temperature: 85°C; Packaging: Tape and Reel; Package Quantity: 1; Output Current: 30mA; Current Rating: 30mA; Min Input Voltage: 2.7V; Series: -; Radiation Hardening: No; Lead Free: Lead Free; RoHS Compliant: Yes; ComponentLink1URL: https://datasheet.ciiva.com/1946/fan5622-1946946.pdf?src-supplier=Digi-Key; ComponentLink1Description: https://datasheet.ciiva.com/1946/fan5622-1946946.pdf?src-supplier=Digi-Key; ComponentLink2URL: https://datasheet.ciiva.com/1946/fan5622-1946947.pdf?src-supplier=Digi-Key; ComponentLink2Description: https://datasheet.ciiva.com/1946/fan5622-1946947.pdf?src-supplier=Digi-Key; ComponentLink3URL: https://datasheet.ciiva.com/1946/fan5622-1946948.pdf?src-supplier=Digi-Key; ComponentLink3Description: https://datasheet.ciiva.com/1946/fan5622-1946948.pdf?src-supplier=Digi-Key; ComponentLink4URL: https://datasheet.ciiva.com/3164/fan5624-3164252.pdf?src-supplier=Avnet; ComponentLink4Description: https://datasheet.ciiva.com/3164/fan5624-3164252.pdf?src-supplier=Avnet; JLCPCB: C890820; Item Type: IC

## Sheet Sensor-Sheet.SchDoc
size A4; SheetNumber: 4; SheetTotal: 5
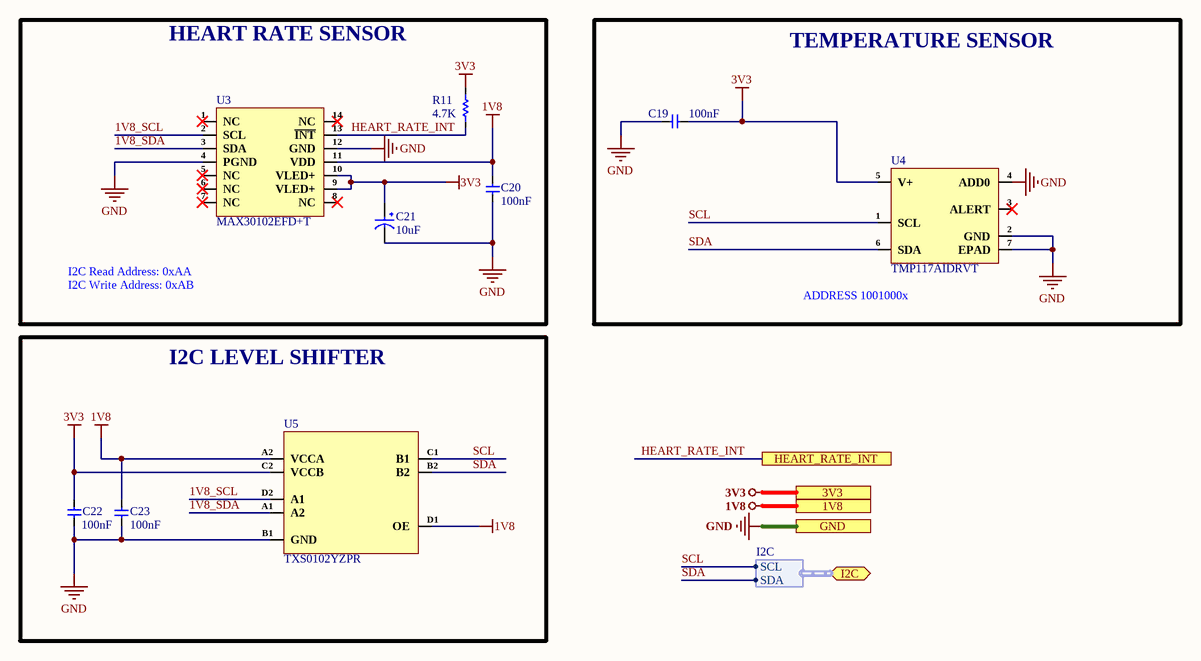
[diagram p4: Sensor-Sheet.SchDoc]

### Parts
C19  100nF  [CAP-0201]
C20  100nF  [CAP-0201]
C21  10uF  [Tant-0603]
C22  100nF  [CAP-0201]
C23  100nF  [CAP-0201]
R11  4.7K  [Res-0201]
U3  MAX30102EFD+T  [MAX30102EFD+T]
U4  TMP117AIDRVT  [WSON-6(2x2)]
U5  TXS0102YZPR  [8-DSBGA]

### Blocks framed on the sheet
HEART RATE SENSOR: C20 C21 R11 U3
TEMPERATURE SENSOR: C19 U4
I2C LEVEL SHIFTER: C22 C23 U5

### Ports
1V8 (see Top-Sheet[3B], Power-Sheet[2D]), 3V3 (see Top-Sheet[3B], Controller-Sheet[3D], Display-Sheet[3D], Power-Sheet[2D]), GND (see Top-Sheet[3B], Controller-Sheet[3D], Display-Sheet[3D], Power-Sheet[2D]), HEART_RATE_INT (see Top-Sheet[3B], Controller-Sheet[3D]), I2C (bidir, harness I2C, see Top-Sheet[3B], Controller-Sheet[1D], Power-Sheet[1D])

### Harnesses
I2C: SCL, SDA

### Nets
1V8: C20.2 C23.2 U3.11(VDD) U5.A2(VCCA) U5.D1(OE) ; port 1V8
3V3: C19.1 C21.1 C22.1 R11.2 U3.9(VLED+) U3.10(VLED+) U4.5(V+) U5.C2(VCCB) ; port 3V3
GND: C19.2 C20.1 C21.2 C22.2 C23.1 U3.4(PGND) U3.12(GND) U4.2(GND) U4.4(ADD0) U4.7(EPAD) U5.B1(GND) ; port GND
1V8_SCL: U3.2(SCL) U5.D2(A1)
1V8_SDA: U3.3(SDA) U5.A1(A2)
HEART_RATE_INT: R11.1 U3.13(~{INT}) ; port HEART_RATE_INT
SCL: U4.1(SCL) U5.C1(B1) ; port I2C.SCL  [project net I2C.SCL]
SDA: U4.6(SDA) U5.B2 ; port I2C.SDA  [project net I2C.SDA]

Not connected (* = marked no-connect by the designer): U3 1(NC)* 5(NC)* 6(NC)* 7(NC)* 8(NC)* 14(NC)*; U4 3(ALERT)*

### Notes on the sheet
- I2C Read Address: 0xAA
  I2C Write Address: 0xAB
- (near U4) ADDRESS 1001000x
- File:
- Title:
- Date:
- Page
- Num:
- Total:
- Drawn By: Huzaifa Ali

### Library data of the parts
C19 C20 C22 C23 = CC0201KRX5R6BB104: as C13 on sheet Power-Sheet; Supplier 1: Mouser; Manufacturer Part Number: CC0201KRX5R6BB104; RoHS: Yes; Category: Ceramic Capacitors; Stock 1: 824403; Pricing 1: 1=0.10000, 10=0.02400, 50=0.02400, 100=0.01900, 1000=0.01100, 10000=0.00900 (USD); Mount: Surface Mount; Case/Package: 0201; Case Code (Imperial): 0201; Case Code (Metric): 0603; Weight: 6E-06oz; Min Operating Temperature: -55°C; Max Operating Temperature: 85°C; Capacitance: 100nF; Dielectric: X5R; Voltage Rating (DC): 10V; Packaging: Tape and Reel; Termination: SMD/SMT; Resistor Type: Ceramic; Voltage Rating: 10V; Series: CC; Construction: Flat; Length: 0.6mm; Width: 0.012inch; Height: 0.3mm; Thickness: 0.013inch; Depth: 0.3mm; Radiation Hardening: No; Lead Free: Lead Free; Halogen Free: Halogen Free; RoHS Compliant: Yes; ComponentLink1URL: https://datasheet.ciiva.com/11587/upy-gphc-x5r-4v-to-50v-12-11587190.pdf?src-supplier=Avnet; ComponentLink1Description: https://datasheet.ciiva.com/11587/upy-gphc-x5r-4v-to-50v-12-11587190.pdf?src-supplier=Avnet; Supplier Part Number 1: 603-CC201KRX5R6BB104; LCSC Part Number: C190183
C21 = T58MM106M6R3C0300: CAP TANT POLY 10UF 6.3V 0603; Manufacturer: Vishay; ESR (Equivalent Series Resistance): 300mR; Tolerance: 20%; Item Type: Capacitor; Supplier: Digi-Key; Supplier Part Number: 718-2111-1-ND; Manufacturer Part Number: T58MM106M6R3C0300; RoHS: Yes; Category: Tantalum Capacitors; Stock: 738; Pricing: 1=0.69, 10=0.462, 50=0.3676, 100=0.3035, 500=0.23714, 1000=0.20158 (USD); Mounting Technology: Surface Mount; Case/Package: 0603; Case Code (Metric): 1608; Case Code (Imperial): 0603; Min Operating Temperature: -55°C; Max Operating Temperature: 105°C; Packaging: Cut Tape; Value: 10uF; Voltage Rating: 6.3V; Voltage Rating (DC): 6.3V; Features: General Purpose; Series: vPolyTan™ T58; Construction: Flat; Length: 1.6mm; Depth: 0.85mm; RoHS Compliant: Yes; Reach SVHC Compliant: Unknown; ComponentLink1URL: http://www.farnell.com/datasheets/2699706.pdf?src-supplier=Farnell; ComponentLink1Description: http://www.farnell.com/datasheets/2699706.pdf?src-supplier=Farnell; ComponentLink2URL: http://www.vishay.com/docs/40189/t58.pdf?src-supplier=Avnet; ComponentLink2Description: http://www.vishay.com/docs/40189/t58.pdf?src-supplier=Avnet; ComponentLink3URL: http://www.farnell.com/datasheets/2028130.pdf?src-supplier=Element14; ComponentLink3Description: http://www.farnell.com/datasheets/2028130.pdf?src-supplier=Element14; ComponentLink4URL: http://www.vishay.com/docs/40189/t58.pdf?src-supplier=Digi-Key; ComponentLink4Description: http://www.vishay.com/docs/40189/t58.pdf?src-supplier=Digi-Key; LCSC Part Number: C2158420
R11 = RC0201FR-074K7L: as R7 on sheet Controller-Sheet; Supplier: Future Electronics; Supplier Part Number: 7537285; Manufacturer Part Number: RC0201FR-074K7L; RoHS: Yes; Category: Chip SMD Resistors; Stock: 1610000; Pricing: 10000=0.0014, 50000=0.0013, 250000=0.0013, 750000=0.0012, 2000000=0.0011 (USD); ComponentLink1URL: https://datasheet.ciiva.com/2493/pyu-r-int-thick-7-2493811.pdf?src-supplier=Digi-Key; ComponentLink1Description: https://datasheet.ciiva.com/2493/pyu-r-int-thick-7-2493811.pdf?src-supplier=Digi-Key; ComponentLink2URL: https://datasheet.ciiva.com/2493/pyu-r-int-thick-7-2493812.pdf?src-supplier=Digi-Key; ComponentLink2Description: https://datasheet.ciiva.com/2493/pyu-r-int-thick-7-2493812.pdf?src-supplier=Digi-Key; ComponentLink3URL: https://datasheet.ciiva.com/2493/pyu-r-int-thick-7-2493813.pdf?src-supplier=Digi-Key; ComponentLink3Description: https://datasheet.ciiva.com/2493/pyu-r-int-thick-7-2493813.pdf?src-supplier=Digi-Key; ComponentLink4URL: https://datasheet.ciiva.com/8892/pyu-rc0201-51-rohs-l-8-8892942.pdf?src-supplier=Avnet; ComponentLink4Description: https://datasheet.ciiva.com/8892/pyu-rc0201-51-rohs-l-8-8892942.pdf?src-supplier=Avnet; ComponentLink5URL: https://datasheet.ciiva.com/7672/1563626-7672233.pdf?src-supplier=Element14; ComponentLink5Description: https://datasheet.ciiva.com/7672/1563626-7672233.pdf?src-supplier=Element14; LCSC Part Number: C138135
U3 = MAX30102EFD+T: SENSOR OXIMETER/HEART RATE I2C; Manufacturer: Maxim; Item Type: Heart Rate Sensor; Supplier: Mouser; Supplier Part Number: 700-MAX30102EFD+T; Manufacturer Part Number: MAX30102EFD+T; RoHS: Yes; Category: Sensors; Stock: 7965; Pricing: 1=12.43, 10=9.84, 50=9.32, 100=7.95, 1000=7.05, 10000=6.66 (USD); Min Operating Temperature: -40°C; Max Operating Temperature: 85°C; Output Type: I2C; Series: -; Packaging: Cut Tape; RoHS Compliant: Yes; ComponentLink1URL: https://datasheets.maximintegrated.com/en/ds/MAX30102.pdf?src-supplier=Digi-Key; ComponentLink1Description: https://datasheets.maximintegrated.com/en/ds/MAX30102.pdf?src-supplier=Digi-Key; LCSC Part Number: C6454833
U4 = TMP117AIDRVT: WSON-6(2x2) Temperature Sensors ROHS; Manufacturer: Texas Instruments; Output Type: I2C; Resolution: 16b; Manufacturer Part Number: TMP117AIDRVT; Package: WSON-6(2x2); LCSC Part Number: C2871850; Item Type: Temperature Sensor; ComponentLink1Description: LCSC; Supplier: Mouser; Supplier Part Number: 595-TMP117AIDRVT; RoHS: Yes; Category: Integrated Circuits (ICs); Stock: 14532; Pricing: 1=6.97, 10=5.24, 50=5.24, 100=4.61, 1000=4.02, 10000=4.02 (USD); Mounting Technology: Surface Mount; Min Operating Temperature: -55°C; Max Operating Temperature: 150°C; Packaging: Cut Tape; Series: -; RoHS Compliant: Yes; ComponentLink2URL: http://www.ti.com/lit/ds/symlink/tmp117.pdf?src-supplier=Digi-Key; ComponentLink2Description: http://www.ti.com/lit/ds/symlink/tmp117.pdf?src-supplier=Digi-Key; ComponentLink3URL: http://www.ti.com/lit/gpn/tmp117?src-supplier=Digi-Key; ComponentLink3Description: http://www.ti.com/lit/gpn/tmp117?src-supplier=Digi-Key
U5 = TXS0102YZPR: IC TRANSLTR BIDIRECTIONAL 8DSBGA; Manufacturer: Texas Instruments; Number of Inputs: 2; Propagation Delay: 260ns; Min Supply Voltage: 1.65V; Max Supply Voltage: 5.5V; Data Rate: 24Mbps; Logic Function: Translator; High Level Output Current: -20uA; Low Level Output Current: 1mA; Turn-On Delay Time: 102ns; Quiescent Current: 14.4uA; Number of Circuits: 1; Rise Time: 165ns; Supplier: Mouser; Supplier Part Number: 595-TXS0102YZPR; Manufacturer Part Number: TXS0102YZPR; RoHS: Yes; Category: Logic ICs; Stock: 48429; Pricing: 1=0.7, 10=0.61, 50=0.61, 100=0.507, 1000=0.402, 10000=0.362 (USD); Mounting Technology: Surface Mount; Case/Package: BGA; Pins: 8; Weight: 8.1E-05oz; Min Operating Temperature: -40°C; Max Operating Temperature: 85°C; Packaging: Tape and Reel; Number of Bits: 2; Series: -; Channel Type: Bidirectional; Output Current: 1mA; Package Quantity: 3000; Length: 1.92mm; Width: 0.918mm; Height: 0.31mm; Radiation Hardening: No; Reach SVHC Compliant: No; Lead Free: Lead Free; RoHS Compliant: Yes; ComponentLink1URL: https://datasheet.ciiva.com/22659/1719892-22659567.pdf?src-supplier=Element14; ComponentLink1Description: https://datasheet.ciiva.com/22659/1719892-22659567.pdf?src-supplier=Element14; ComponentLink2URL: https://datasheet.ciiva.com/1508/1828155-1508731.pdf?src-supplier=Element14; ComponentLink2Description: https://datasheet.ciiva.com/1508/1828155-1508731.pdf?src-supplier=Element14; ComponentLink3URL: https://datasheet.ciiva.com/15096/getdatasheetpartid-376613-15096286.pdf?src-supplier=Verical; ComponentLink3Description: https://datasheet.ciiva.com/15096/getdatasheetpartid-376613-15096286.pdf?src-supplier=Verical; ComponentLink4URL: https://datasheet.ciiva.com/1899/txs0102-1899401.pdf?src-supplier=Digi-Key; ComponentLink4Description: https://datasheet.ciiva.com/1899/txs0102-1899401.pdf?src-supplier=Digi-Key; ComponentLink5URL: https://datasheet.ciiva.com/1899/txs0102-1899402.pdf?src-supplier=Digi-Key; ComponentLink5Description: https://datasheet.ciiva.com/1899/txs0102-1899402.pdf?src-supplier=Digi-Key; ComponentLink6URL: https://datasheet.ciiva.com/1899/txs0102-1899403.pdf?src-supplier=Digi-Key; ComponentLink6Description: https://datasheet.ciiva.com/1899/txs0102-1899403.pdf?src-supplier=Digi-Key; ComponentLink7URL: https://datasheet.ciiva.com/14287/txs0102-14287925.pdf?src-supplier=Avnet; ComponentLink7Description: https://datasheet.ciiva.com/14287/txs0102-14287925.pdf?src-supplier=Avnet; ComponentLink8URL: https://datasheet.ciiva.com/48701/001073841-da-01-en-ic-volt-level-tr-txs0102yzpr-dsbga-8-tid-48701989.pdf?src-supplier=Conrad; ComponentLink8Description: https://datasheet.ciiva.com/48701/001073841-da-01-en-ic-volt-level-tr-txs0102yzpr-dsbga-8-tid-48701989.pdf?src-supplier=Conrad; LCSC Part Number: C353037; Item Type: IC

## Nets that join several sheets
1V8: Power-Sheet (C24.2 P6.1 U1.18), Sensor-Sheet (5 pins)
3V3: Power-Sheet (5 pins), Controller-Sheet (9 pins), Display-Sheet (11 pins), Sensor-Sheet (8 pins)
GND: Power-Sheet (28 pins), Controller-Sheet (30 pins), Display-Sheet (9 pins), Sensor-Sheet (11 pins)
AXP_INT: Power-Sheet (R4.1 U1.38), Controller-Sheet (U2.18)
CSX: Controller-Sheet (U2.21), Display-Sheet (J4.9)
CTP_INT: Controller-Sheet (U2.6), Display-Sheet (J4.21)
CTP_RST: Controller-Sheet (C18.2 J3.6 R5.1 U2.8), Display-Sheet (J4.10 J4.18)
DISPLAY_BLK: Controller-Sheet (R9.1 R14.1), Display-Sheet (U6.1)
HEART_RATE_INT: Controller-Sheet (U2.16), Sensor-Sheet (R11.1 U3.13)
I2C.SCL: Power-Sheet (P2.1 U1.40), Controller-Sheet (R7.1 U2.20), Display-Sheet (J4.20), Sensor-Sheet (U4.1 U5.C1)
I2C.SDA: Power-Sheet (P4.1 U1.39), Controller-Sheet (R8.1 U2.19), Display-Sheet (J4.19), Sensor-Sheet (U4.6 U5.B2)
RS: Controller-Sheet (R6.1 R13.1), Display-Sheet (J4.5)
SCL_L: Controller-Sheet (U2.13), Display-Sheet (J4.8)
SDI: Controller-Sheet (U2.12), Display-Sheet (J4.6)
USB_N: Power-Sheet (J1.A7 J1.B7), Controller-Sheet (U2.26)
USB_P: Power-Sheet (J1.A6 J1.B6), Controller-Sheet (U2.27)